# Altium schematic sheet Actuator.SchDoc
size A4; SheetNumber: 4; SheetTotal: 4
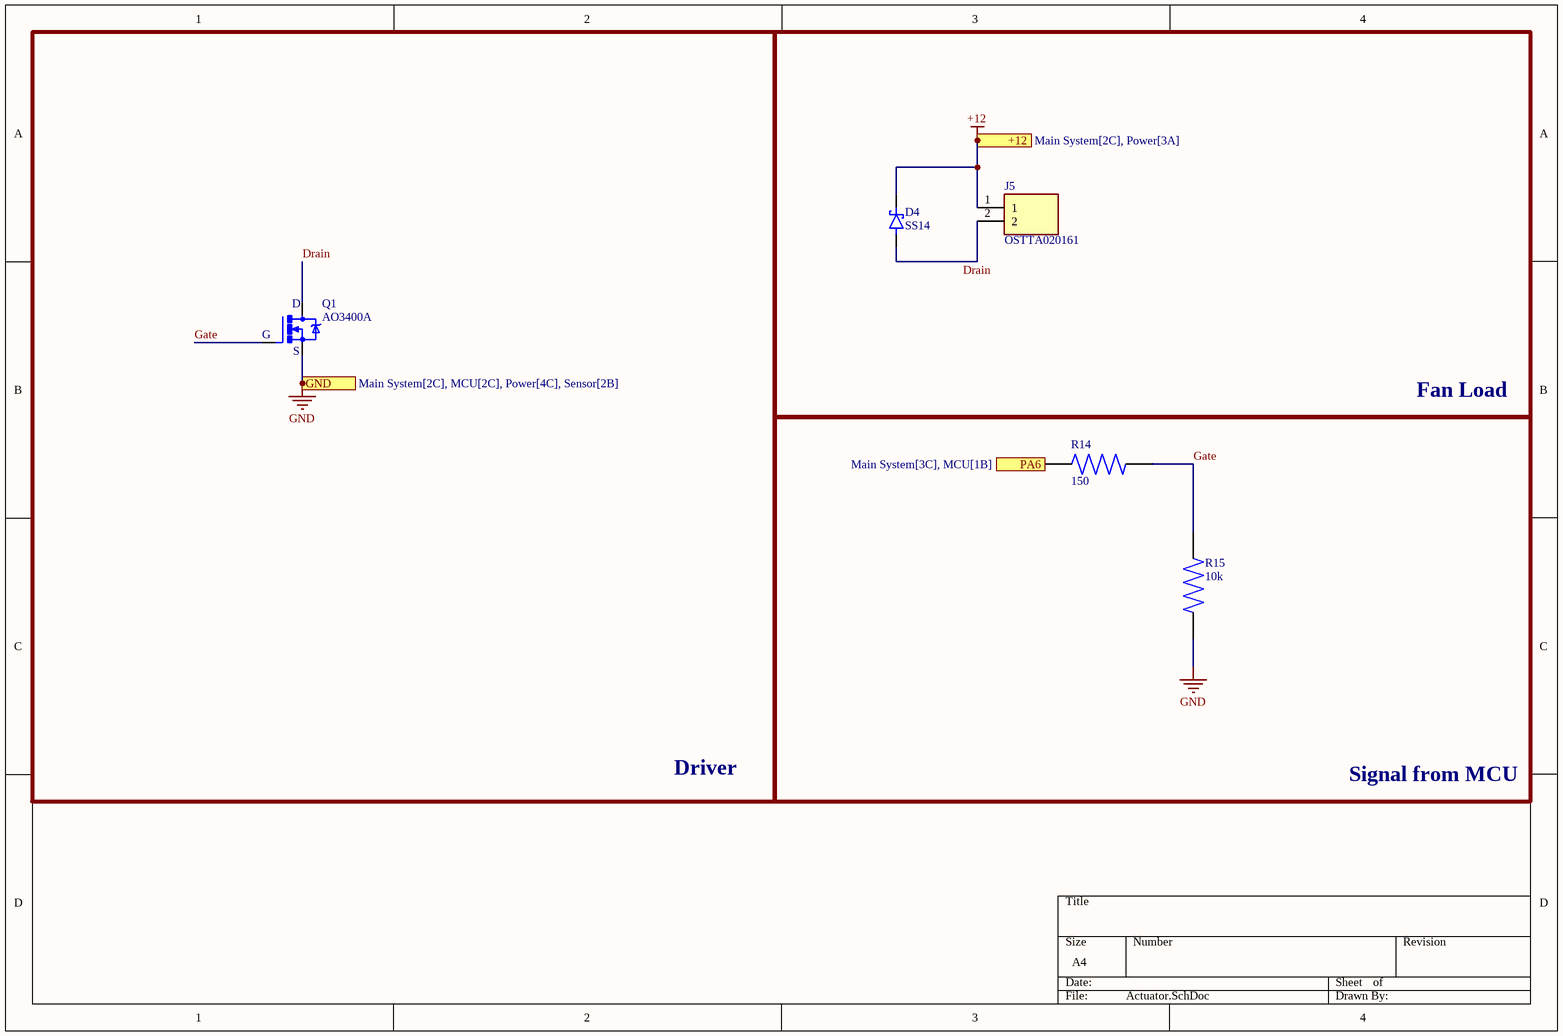
[diagram p0: Actuator.SchDoc]

## Parts
D4  SS14  [DIOM4325X250N]
J5  OSTTA020161  [ONSHORE_OSTTA020161]
Q1  AO3400A  [SOT23-3]
R14  150  [RESC1005X40N]
R15  10k  [RESC1005X40N]

## Blocks framed on the sheet
Driver: Q1
Fan Load: D4 J5
Signal from MCU: R14 R15

## Ports
+12 (see Main System[2C], Power[3A]), GND (see Main System[2C], MCU[2C], Power[4C], Sensor[2B]), PA6 (see Main System[3C], MCU[1B])

## Nets
+12: D4.C(K) J5.1 ; port +12
GND: Q1.2(S) R15.2 ; port GND
Drain: D4.A J5.2 Q1.3(D)
Gate: Q1.1(G) R14.2 R15.1
PA6: R14.1 ; port PA6

## Library data of the parts
D4 = SS14: 1A, 40V, Schottky Rectifier; MF: Taiwan Semiconductor; SnapEDA_Link: https://www.snapeda.com/parts/SS14/taiwan/view-part/?ref=snap; Package: SMA-2 Taiwan Semiconductor; Value: *; MP: SS14; Check_prices: https://www.snapeda.com/parts/SS14/taiwan/view-part/?ref=eda
Q1 = AO3400A: N-Channel 30 V 5.8A (Ta) 1.4W (Ta) Surface Mount SOT-23; MF: UMW; SnapEDA_Link: https://www.snapeda.com/parts/AO3400A/UMW/view-part/?ref=snap; Package: None; Value: *; MP: AO3400A; Check_prices: https://www.snapeda.com/parts/AO3400A/UMW/view-part/?ref=eda
R14 R15 = CRCW040210K0FKED: Resistor;Thick Film;10 Kilohms;0.063 W;1%;SMT;0402;TCR 37 ppm/DegC;Tape and Reel | Vishay Dale CRCW040210K0FKED; SnapEDA_Link: https://www.snapeda.com/parts/CRCW040210K0FKED/Dale/view-part/?ref=snap; Package: Package; Value: *; MF: Vishay Dale; MP: CRCW040210K0FKED; Check_prices: https://www.snapeda.com/parts/CRCW040210K0FKED/Dale/view-part/?ref=eda
J5 = OSTTA020161: Package: None; Price: None; Value: *; MP: OSTTA020161; Availability: Unavailable